# Altium schematic sheet POWER-1.SchDoc
size A4
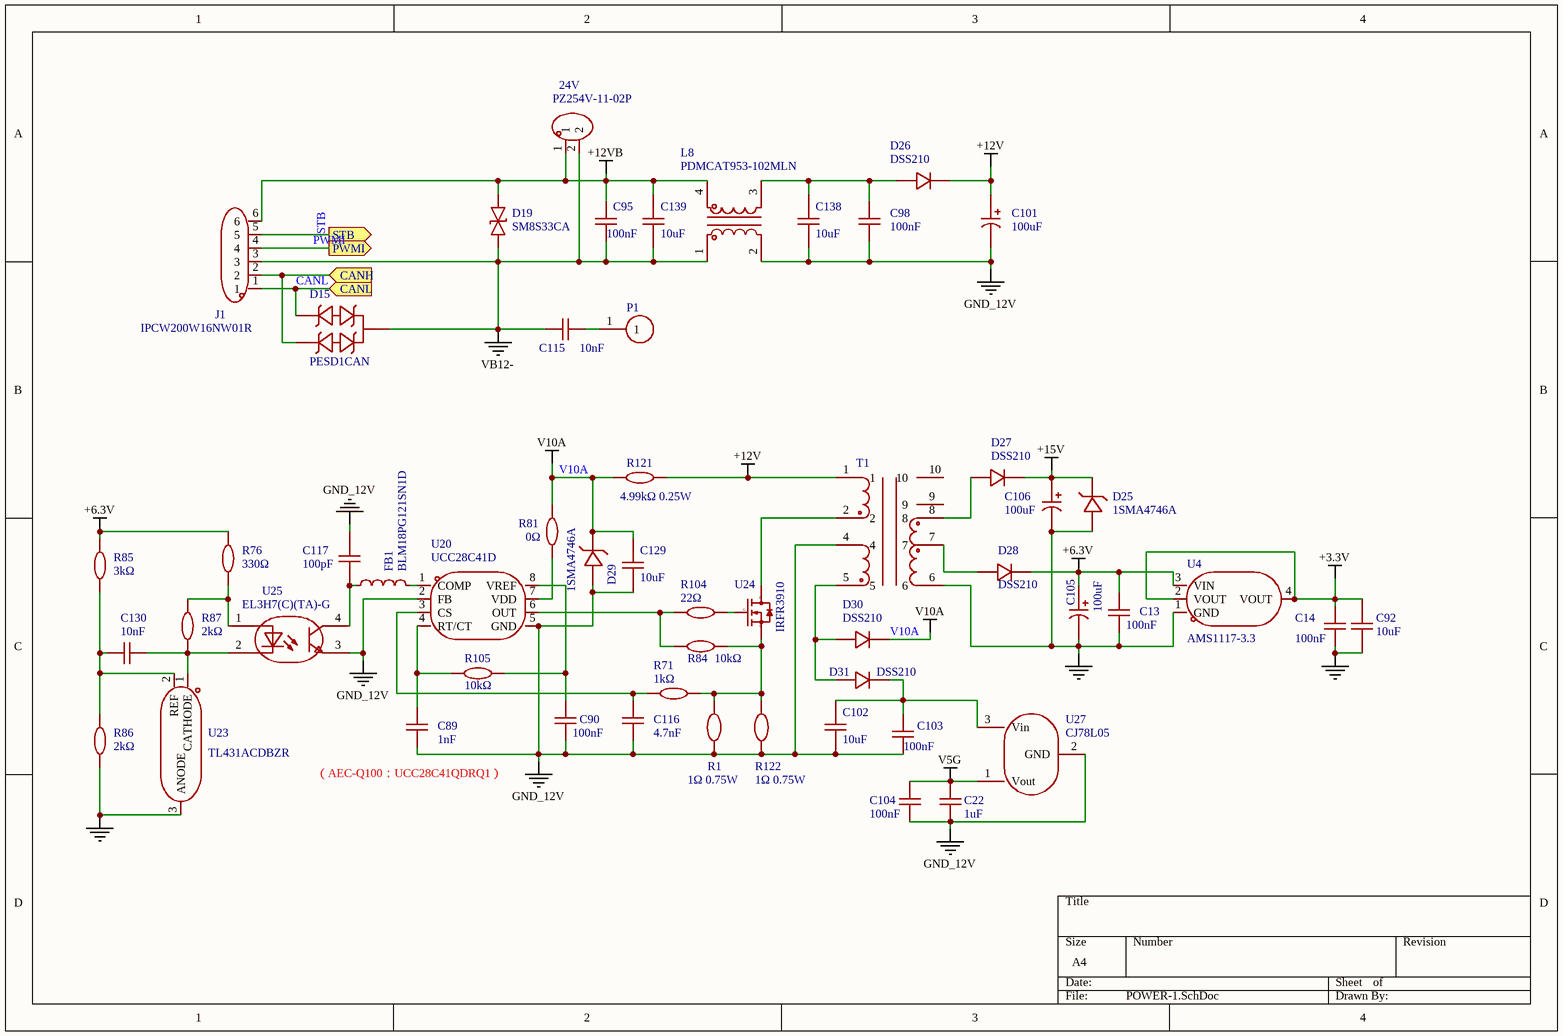
[diagram p0: POWER-1.SchDoc]

## Parts
24V  PZ254V-11-02P  [jp2]
C13  100nF  [C0603]
C14  100nF  [C0603]
C22  1uF  [C0603]
C89  1nF  [C0603]
C90  100nF  [C0603]
C92  10uF  [C1206]
C95  100nF  [C0603]
C98  100nF  [C0603]
C101  100uF  [CAP-SMD_BD6.3-L6.6-W6.6-LS7.6-FD-1]
C102  10uF  [C1206]
C103  100nF  [C0603]
C104  100nF  [C0603]
C105  100uF  [CAP-SMD_BD6.3-L6.6-W6.6-LS7.6-FD-1]
C106  100uF  [CAP-SMD_BD6.3-L6.6-W6.6-LS7.6-FD-1]
C115  10nF  [C1206]
C116  4.7nF  [C0603]
C117  100pF  [C0603]
C129  10uF  [C1206]
C130  10nF  [C0603]
C138  10uF  [C1206]
C139  10uF  [C1206]
D15  PESD1CAN  [SOT-23-3_L2.9-W1.6-P1.90-LS2.8-BR]
D19  SM8S33CA  [DO-218AB_L13.5-W8.4-LS15.5-BI]
D25  1SMA4746A  [SMA_L4.4-W2.6-LS5.0-RD]
D26  DSS210  [SOD-123_L2.8-W1.8-LS3.7-FD]
D27  DSS210  [SOD-123_L2.8-W1.8-LS3.7-FD]
D28  DSS210  [SOD-123_L2.8-W1.8-LS3.7-FD]
D29  1SMA4746A  [SMA_L4.4-W2.6-LS5.0-RD]
D30  DSS210  [SOD-123_L2.8-W1.8-LS3.7-FD]
D31  DSS210  [SOD-123_L2.8-W1.8-LS3.7-FD]
FB1  BLM18PG121SN1D  [L0603]
J1  IPCW200W16NW01R  [CONN-TH_6P-P2.00_INCP_IPCW200W16XWXXR]
L8  PDMCAT953-102MLN  [IND-TH_4P-L12.0-W6.0_PDMCAT953-501MLN]
P1  (no value)  [HOLE-3.5]
R1  1Ω 0.75W  [R1206]
R71  1kΩ  [R0603]
R76  330Ω  [R0603]
R81  0Ω  [R0603]
R84  10kΩ  [R0603]
R85  3kΩ  [R0603]
R86  2kΩ  [R0603]
R87  2kΩ  [R0603]
R104  22Ω  [R0603]
R105  10kΩ  [R0603]
R121  4.99kΩ 0.25W  [R0805]
R122  1Ω 0.75W  [R1206]
T1  (no value)  [汽车空调压缩机板-变压器]
U4  AMS1117-3.3  [SOT-223-3_L6.5-W3.4-P2.30-LS7.0-BR]
U20  UCC28C41D  [SOIC-8_L4.9-W3.9-P1.27-LS6.0-BL]
U23  TL431ACDBZR  [SOT-23-3_L3.0-W1.7-P0.95-LS2.9-BR]
U24  IRFR3910  [TO-252-2_L6.6-W6.1-P4.57-LS9.9-BR-CW]
U25  EL3H7(C)(TA)-G  [SMD-4_L2.7-W4.4-P1.27-LS7.0-BL]
U27  CJ78L05  [SOT-89-3_L4.5-W2.5-P1.50-LS4.2-BR]

## Ports
CANH (in), CANL (in), PWMI (out), STB (out)

## Nets
+3.3V: C14.1 C92.2 U4.2(VOUT) U4.4(VOUT)
+6.3V: C13.1 C105.1 D28.2(K) R76.2 R85.2 U4.3(VIN)
+12V: C101.1 D26.2(K) R121.2 T1.1
+12VB: 24V.1 C95.1 C139.2 D19.2 J1.6 L8.4
+15V: C106.1 D25.1(K) D27.2(K)
GND: C13.2 C14.2 C92.1 C105.2 C106.2 D25.2(A) R86.1 T1.6 U4.1(GND) U23.3(ANODE)
GND_12V: C22.1 C89.1 C90.2 C98.2 C101.2 C102.1 C103.2 C104.2 C116.1 C117.2 C129.1 C138.1 D29.2(A) L8.2 R1.1 R122.1 T1.4 U20.2(FB) U20.5(GND) U25.3 U27.2(GND)
V5G: C22.2 C104.1 U27.1(Vout)
V10A: C129.2 D29.1(K) D30.2(K) R81.2 R121.1
VB12-: 24V.2 C95.2 C115.1 C139.1 D15.3 D19.1 J1.3 L8.1
CANH: D15.1 J1.2 ; port CANH
CANL: D15.2 J1.1 ; port CANL
PWMI: J1.4 ; port PWMI
STB: J1.5 ; port STB
NetC89_2: C89.2 R105.1 U20.4(RT/CT)
NetC90_1: C90.1 R105.2 U20.8(VREF)
NetC98_1: C98.1 C138.2 D26.1(A) L8.3
NetC102_2: C102.2 C103.1 D31.2(K) U27.3(Vin)
NetC115_2: C115.2 P1.1
NetC116_2: C116.2 R71.1 U20.3(CS)
NetC117_1: C117.1 FB1.1 U25.4
NetC130_1: C130.1 R85.1 R86.2 U23.2(REF)
NetC130_2: C130.2 R87.2 U23.1(CATHODE) U25.2
NetD27_1: D27.1(A) T1.8
NetD28_1: D28.1(A) T1.7
NetD30_1: D30.1(A) D31.1(A) T1.5
NetFB1_2: FB1.2 U20.1(COMP)
NetR1_2: R1.2 R71.2 R84.2 R122.2 U24.3(S)
NetR76_1: R76.1 R87.1 U25.1
NetR81_1: R81.1 U20.7(VDD)
NetR84_1: R84.1 R104.1 U20.6(OUT)
NetR104_2: R104.2 U24.1(G)
NetT1_2: T1.2 U24.2(D)

Not connected (* = marked no-connect by the designer): T1 9 10

## Notes on the sheet
- (near C89) （AEC-Q100：UCC28C41QDRQ1）

## Library data of the parts
24V = PZ254V-11-02P: 插针结构:1x2P;间距:2.54mm;行距:-;圆针/方针:方针;安装类型:直插;排数:单排;总PIN位数:2P;额定电流:-;额定电压:-;配合针长度:6mm;塑高:2.5mm;端接针长度:3mm;触头材质:黄铜;触头镀层:-;工作温度范围:-40℃~+105℃;颜色:黑色;; Manufacturer: XFCN(兴飞); Add into BOM: yes; Pin Structure: 1x2P; Pitch: 2.54mm; Circluar Pins/Square Pins: 方针; Symbol: PZ254V-11-02P; Device: PZ254V-11-02P; Supplier: LCSC; Supplier Part: C492401; Manufacturer Part: PZ254V-11-02P; JLCPCB Part Class: Extended Part; LCSC Part Name: 间距:2.54mm 1x2P 直插 方针; Supplier Footprint: 插件,P=2.54mm; Datasheet: https://atta.szlcsc.com/upload/public/pdf/source/20200309/C492401_A812433581A9B211A7FFA413ADDFF0E5.pdf; Convert to PCB: yes; Row Spacing: -; Mounting Type: 直插; Number of Rows: 单排; Number of Pins: 2P; Current Rating (Max): -; Voltage Rating (Max): -; Length of Mating Pin: 6mm; Insulation Height: 2.5mm; Length of End Connection Pin: 3mm; Contact Material: 黄铜; Contact Plating: -; Operating Temperature Range: -40℃~+105℃; Color: 黑色; Comment_1: PZ254V-11-02P
C13 C14 C90 C95 C98 C103 C104 = 0603B104K500NT: 容值:100nF;精度:±10%;额定电压:50V;材质(温度系数):X7R;; Manufacturer: FH(风华); Add into BOM: yes; Tolerance: ±10%; Voltage Rated: 50V; Temperature Coefficient: X7R; Symbol: 0603B104K500NT; Device: 0603B104K500NT; Supplier: LCSC; Manufacturer Part: 0603B104K500NT; Value: 100nF; Supplier Part: C30926; JLCPCB Part Class: 扩展库; LCSC Part Name: 100nF ±10% 50V; Supplier Footprint: 0603; Datasheet: https://atta.szlcsc.com/upload/public/pdf/source/20200305/C486355_26A10D38EF8C2A5C37091D0039909270.pdf; Convert to PCB: yes; Comment_1: 100nF
C22 = 0603B105K250NT: 容值:1uF;精度:±10%;额定电压:25V;材质(温度系数):X7R;; Manufacturer: FH(风华); Add into BOM: yes; Tolerance: ±10%; Voltage Rated: 25V; Temperature Coefficient: X7R; Symbol: 0603B105K250NT; Device: 0603B105K250NT; LCSC Part Name: 1uF ±10% 25V; Supplier Part: C59302; Manufacturer Part: 0603B105K250NT; Supplier Footprint: 0603; JLCPCB Part Class: 扩展库; Datasheet: https://atta.szlcsc.com/upload/public/pdf/source/20200305/C486355_26A10D38EF8C2A5C37091D0039909270.pdf; Supplier: LCSC; Convert to PCB: yes; Value: 1uF; Comment_1: 1uF
C89 = CC0603KRX7R9BB102: 容值:1nF;精度:±10%;额定电压:50V;材质(温度系数):X7R;; Manufacturer: YAGEO(国巨); Add into BOM: yes; Tolerance: ±10%; Voltage Rated: 50V; Temperature Coefficient: X7R; Symbol: CC0603KRX7R9BB102; Device: CC0603KRX7R9BB102; Supplier: LCSC; Manufacturer Part: CC0603KRX7R9BB102; Value: 1nF; Supplier Part: C100040; JLCPCB Part Class: 扩展库; LCSC Part Name: 1nF ±10% 50V; Supplier Footprint: 0603; Datasheet: https://atta.szlcsc.com/upload/public/pdf/source/20180910/C282072_33301C7F631E79921B82A8DAC6BCC5B3.pdf; Convert to PCB: yes; Comment_1: 1nF
C92 C102 C129 C138 C139 = 1206B106K250NT: 容值:10uF;精度:±10%;额定电压:25V;材质(温度系数):X7R;; Manufacturer: FH(风华); Add into BOM: yes; Tolerance: ±10%; Voltage Rated: 25V; Temperature Coefficient: X7R; Symbol: 1206B106K250NT; Device: 1206B106K250NT; Supplier: LCSC; Manufacturer Part: 1206B106K250NT; Value: 10uF; Supplier Part: C90538; JLCPCB Part Class: 扩展库; LCSC Part Name: 10uF ±10% 25V; Supplier Footprint: 1206; Datasheet: https://atta.szlcsc.com/upload/public/pdf/source/20200305/C486355_26A10D38EF8C2A5C37091D0039909270.pdf; Convert to PCB: yes; Comment_1: 10uF
C101 C105 C106 = RVE100UF35V67RV0072: 容值:100uF;精度:±20%;额定电压:35V;纹波电流:230mA@120Hz;等效串联电阻:600mΩ@100kHz;; Manufacturer: KNSCHA(科尼盛); Add into BOM: yes; Tolerance: ±20%; Rated Voltage: 35V; φD: 6.3mm; L: 7.7mm; Lifetime @ Temp: 2000hrs@105℃; Symbol: RVE100UF35V67RV0072; Device: RVE100UF35V67RV0072; Supplier: LCSC; Supplier Part: C2836437; Manufacturer Part: RVE100UF35V67RV0072; Value: 100uF; JLCPCB Part Class: 扩展库; LCSC Part Name: 100uF ±20% 35V; Supplier Footprint: SMD,D6.3xL7.7mm; Datasheet: https://atta.szlcsc.com/upload/public/pdf/source/20220719/B52EB46F8A1558448ED03D8B4CB3C24F.pdf; Convert to PCB: yes; Ripple Current: 230mA@120Hz; Equivalent Series Resistance(ESR): 600mΩ@100kHz; Operating Temperature: -55℃~+105℃; Comment_1: 100uF
C115 = 1206B103K202NT: 容值:10nF;精度:±10%;额定电压:2kV;材质(温度系数):X7R;; Manufacturer: FH(风华); Add into BOM: yes; Tolerance: ±10%; Voltage Rated: 2kV; Temperature Coefficient: X7R; Symbol: 1206B103K202NT; Device: 1206B103K202NT; Supplier: LCSC; Manufacturer Part: 1206B103K202NT; Value: 10nF; Supplier Part: C53737; JLCPCB Part Class: 扩展库; LCSC Part Name: 10nF ±10% 2kV; Supplier Footprint: 1206; Datasheet: https://atta.szlcsc.com/upload/public/pdf/source/20200305/C486355_26A10D38EF8C2A5C37091D0039909270.pdf; Convert to PCB: yes; Comment_1: 10nF
C116 = 0603B472K500NT: 容值:4.7nF;精度:±10%;额定电压:50V;材质(温度系数):X7R;; Manufacturer: FH(风华); Add into BOM: yes; Tolerance: ±10%; Voltage Rated: 50V; Temperature Coefficient: X7R; Symbol: 0603B472K500NT; Device: 0603B472K500NT; LCSC Part Name: 4.7nF ±10% 50V; Supplier Part: C53987; Manufacturer Part: 0603B472K500NT; Supplier Footprint: 0603; JLCPCB Part Class: 基础库; Datasheet: https://atta.szlcsc.com/upload/public/pdf/source/20200305/C486355_26A10D38EF8C2A5C37091D0039909270.pdf; Supplier: LCSC; Convert to PCB: yes; Value: 4.7nF; Comment_1: 4.7nF
C117 = CC0603JRNPO9BN101: 容值:100pF;精度:±5%;额定电压:50V;材质(温度系数):NP0;; Manufacturer: YAGEO(国巨); Add into BOM: yes; Tolerance: ±5%; Voltage Rated: 50V; Temperature Coefficient: NP0; Symbol: CC0603JRNPO9BN101; Device: CC0603JRNPO9BN101; Supplier: LCSC; Manufacturer Part: CC0603JRNPO9BN101; Value: 100pF; Supplier Part: C14665; JLCPCB Part Class: 扩展库; LCSC Part Name: 100pF ±5% 50V; Supplier Footprint: 0603; Datasheet: https://atta.szlcsc.com/upload/public/pdf/source/20181008/C309499_21CC21451B82C39E3D92150FD6B30293.pdf; Convert to PCB: yes; Comment_1: 100pF
C130 = CC0603KRX7R9BB103: 容值:10nF;精度:±10%;额定电压:50V;材质(温度系数):X7R;; Manufacturer: YAGEO(国巨); Add into BOM: yes; Tolerance: ±10%; Voltage Rated: 50V; Temperature Coefficient: X7R; Symbol: CC0603KRX7R9BB103; Device: CC0603KRX7R9BB103; Supplier: LCSC; Manufacturer Part: CC0603KRX7R9BB103; Value: 10nF; Supplier Part: C100042; JLCPCB Part Class: 扩展库; LCSC Part Name: 10nF ±10% 50V; Supplier Footprint: 0603; Datasheet: https://atta.szlcsc.com/upload/public/pdf/source/20181008/C309510_22F155564471FAF6A489F7D68F34234E.pdf; Convert to PCB: yes; Comment_1: 10nF
D15 = PESD1CAN_C907838: Manufacturer: TECH PUBLIC(台舟); Add into BOM: yes; Symbol: PESD1CAN_C907838; Device: PESD1CAN_C907838; Supplier: LCSC; Supplier Part: C907838; Manufacturer Part: PESD1CAN; JLCPCB Part Class: 扩展库; LCSC Part Name: PESD1CAN 丝印tAN 双向24V; Supplier Footprint: SOT-23; Datasheet: https://atta.szlcsc.com/upload/public/pdf/source/20210810/FCC54A7A88EA9EF2EA40F9636152B7D7.pdf; Convert to PCB: yes; Comment_1: PESD1CAN
D19 = SM8S33CA_C314434: 反向截止电压(Vrwm):33V;最大钳位电压:53.3V;峰值脉冲电流(Ipp)@10/1000us:124A;击穿电压:36.7V;; Manufacturer: DOWO(东沃); Add into BOM: yes; Reverse Stand-Off Voltage (Vrwm): 33V; Maximum Clamping Voltage: 53.3V; Peak Pulse Current (Ipp)@10/1000us: 124A; Breakdown Voltage: 36.7V; Reverse Leakage Current (Ir): 10uA; Type: TVS; Symbol: SM8S33CA; Device: SM8S33CA_C314434; LCSC Part Name: TVS 33V截止 124A峰值脉冲; Supplier Part: C314434; Manufacturer Part: SM8S33CA; Supplier Footprint: DO-218AB; JLCPCB Part Class: 扩展库; Datasheet: https://atta.szlcsc.com/upload/public/pdf/source/20181106/C314437_31B54DA73456FA681A2859957BB4B0B1.pdf; Supplier: LCSC; Convert to PCB: yes; Comment_1: SM8S33CA
D25 D29 = 1SMA4746A_C173483: 二极管配置:独立式;稳压值(标称值):18V;稳压值(范围):17.1V~18.9V;功率:1W;精度:-;; Manufacturer: MDD; Add into BOM: yes; Diode Configuration: 独立式; Zener Voltage (Nom): 18V; Reverse Leakage Current (Ir): 5uA@13.7V; Power Dissipation: 1W; Zener Impedance (Zzt): 20Ω; Symbol: 1SMA4746A_C173483; Device: 1SMA4746A_C173483; Supplier: LCSC; Supplier Part: C173483; Manufacturer Part: 1SMA4746A; JLCPCB Part Class: 扩展库; LCSC Part Name: 1SMA4746A; Supplier Footprint: SMA(DO-214AC); Datasheet: https://atta.szlcsc.com/upload/public/pdf/source/20230314/D3FB3E27E1B37F88B63DBD3F994A8ACA.pdf; Convert to PCB: yes; Zener Voltage (Range): 17.1V~18.9V; Tolerance: -; Comment_1: 1SMA4746A
D26-D28 D30 D31 = DSS210_C511868: 正向压降(Vf):850mV@2A;直流反向耐压(Vr):100V;平均整流电流(Io):2A;; Manufacturer: BORN(伯恩半导体); Add into BOM: yes; Reverse Voltage (Vr): 100V; Average Rectified Current (Io): 2A; Symbol: DSS210; Device: DSS210_C511868; Supplier: LCSC; Supplier Part: C511868; Manufacturer Part: DSS210; JLCPCB Part Class: 扩展库; LCSC Part Name: 电压:100V 电流:2A; Supplier Footprint: SOD-123FL; Datasheet: https://atta.szlcsc.com/upload/public/pdf/source/20230516/9F85296B942B21E2E4298CE8290C4B88.pdf; Convert to PCB: yes; Forward Voltage (Vf@If): 850mV@2A; Comment_1: DSS210
FB1 = BLM18PG121SN1D: 标称阻抗@测试频率:120Ω@100MHz;误差:±25%;直流电阻(RDC):50mΩ;; Manufacturer: muRata(村田); Symbol: BLM18PG121SN1D_C14709; Add into BOM: yes; Tolerance: ±25%; DC Resistance: 50mΩ; Current Rating: 2A; Circuits: 1; Device: BLM18PG121SN1D; LCSC Part Name: 单路 0603磁珠 阻抗120Ω@100MHz; Supplier Part: C14709; Manufacturer Part: BLM18PG121SN1D; Supplier Footprint: 0603; JLCPCB Part Class: 扩展库; Datasheet: https://atta.szlcsc.com/upload/public/pdf/source/20130704/1457706621422.pdf; Supplier: LCSC; Convert to PCB: yes; Impedance @ Frequency: 120Ω@100MHz; Comment_1: BLM18PG121SN1D
J1 = IPCW200W16NW01R: 插针结构:1x6P;间距:2mm;安装方式:弯插;参考系列:PH;总PIN数:6P;排数:1;每排PIN数:6;工作温度范围:-25℃~+85℃;; Manufacturer: INCP; Add into BOM: yes; Pins Structure: 1x6P; Pitch: 2mm; Reference Series: PH; Number of PINs Per Row: 6; Symbol: IPCW200W16NW01R; Device: IPCW200W16NW01R; Supplier: LCSC; Supplier Part: C2982159; Manufacturer Part: IPCW200W16NW01R; JLCPCB Part Class: 扩展库; LCSC Part Name: IPCW200W16NW01R; Supplier Footprint: 弯插,P=2mm; Datasheet: https://atta.szlcsc.com/upload/public/pdf/source/20220328/BD62D14CAC78066D83B81F1997E899D7.pdf; Convert to PCB: yes; Mounting Style: 弯插; Number of Pins: 6P; Number of Rows: 1; Operating Temperature Range: -25℃~+85℃; Comment_1: IPCW200W16NW01R
L8 = PDMCAT953-102MLN: 线路数:2;电感 @ 频率:1mH@1kHz;直流电阻(DCR):25mΩ;; Manufacturer: PROD(谱罗德); Add into BOM: yes; Number of Lines: 2; Current Rating: 1.5A; DC Resistance (DCR): 25mΩ; Symbol: PDMCAT953-102MLN; Device: PDMCAT953-102MLN; Supplier: LCSC; Supplier Part: C5158067; Manufacturer Part: PDMCAT953-102MLN; JLCPCB Part Class: 扩展库; LCSC Part Name: 共模电感1mH 1.5A 25mΩMAX 953环 过EMC; Supplier Footprint: 插件; Datasheet: https://atta.szlcsc.com/upload/public/pdf/source/20220920/90718629BFB021D2715AF2FDDA682A79.pdf; Convert to PCB: yes; Inductance @ Frequency: 1mH@1kHz; Comment_1: PDMCAT953-102MLN
P1 = PAD-ED: Add into BOM: yes; Symbol: PAD-ED; Device: PAD-ED; Convert to PCB: yes; Comment_1: PAD-ED
R1 R122 = CRCW12061R00FKEAHP: 电阻类型:厚膜电阻;阻值:1Ω;精度:±1%;功率:750mW;温度系数:±100ppm/℃;; Manufacturer: VISHAY(威世); Add into BOM: yes; Tolerance: ±1%; Power(Watts): 750mW; Symbol: CRCW12061R00FKEAHP; Device: CRCW12061R00FKEAHP; LCSC Part Name: 厚膜电阻 1Ω ±1% 750mW; Supplier Part: C844653; Manufacturer Part: CRCW12061R00FKEAHP; Supplier Footprint: 1206; JLCPCB Part Class: 扩展库; Datasheet: https://atta.szlcsc.com/upload/public/pdf/source/20221018/EBA0766182E7785923AA75C06FB4488F.pdf; Supplier: LCSC; Convert to PCB: yes; Type: 厚膜电阻; Value: 1Ω 0.75W; Temperature Coefficient: ±100ppm/℃; Operating Temperature Range: -55℃~+155℃; Comment_1: 1Ω 0.75W
R71 = 0603WAF1001T5E: 电阻类型:厚膜电阻;阻值:1kΩ;精度:±1%;功率:100mW;最大工作电压:75V;温度系数:±100ppm/℃;; Manufacturer: UNI-ROYAL(厚声); Add into BOM: yes; Tolerance: ±1%; Power(Watts): 100mW; Overload Voltage (Max): 75V; Symbol: 0603WAF1001T5E; Device: 0603WAF1001T5E; Supplier: LCSC; Manufacturer Part: 0603WAF1001T5E; Supplier Part: C21190; Value: 1kΩ; JLCPCB Part Class: 基础库; LCSC Part Name: 1kΩ ±1% 100mW 厚膜电阻; Supplier Footprint: 0603; Datasheet: https://atta.szlcsc.com/upload/public/pdf/source/20200306/C422600_1E6D84923E4A46A82E41ADD87F860B5C.pdf; Convert to PCB: yes; Type: 厚膜电阻; Temperature Coefficient: ±100ppm/℃; Operating Temperature Range: -55℃~+155℃; Comment_1: 1kΩ
R76 = 0603WAF3300T5E: 电阻类型:厚膜电阻;阻值:330Ω;精度:±1%;功率:100mW;最大工作电压:75V;温度系数:±100ppm/℃;; Manufacturer: UNI-ROYAL(厚声); Add into BOM: yes; Tolerance: ±1%; Power(Watts): 100mW; Overload Voltage (Max): 75V; Symbol: 0603WAF3300T5E; Device: 0603WAF3300T5E; Supplier: LCSC; Manufacturer Part: 0603WAF3300T5E; Supplier Part: C23138; Value: 330Ω; JLCPCB Part Class: 基础库; LCSC Part Name: 330Ω ±1% 100mW 厚膜电阻; Supplier Footprint: 0603; Datasheet: https://atta.szlcsc.com/upload/public/pdf/source/20200306/C422600_1E6D84923E4A46A82E41ADD87F860B5C.pdf; Convert to PCB: yes; Type: 厚膜电阻; Temperature Coefficient: ±100ppm/℃; Operating Temperature Range: -55℃~+155℃; Comment_1: 330Ω
R81 = 0603WAF0000T5E: 电阻类型:厚膜电阻;阻值:0Ω;精度:±1%;功率:100mW;最大工作电压:75V;; Manufacturer: UNI-ROYAL(厚声); Add into BOM: yes; Tolerance: ±1%; Power(Watts): 100mW; Overload Voltage (Max): 75V; Symbol: 0603WAF0000T5E; Device: 0603WAF0000T5E; Supplier: LCSC; Manufacturer Part: 0603WAF0000T5E; Supplier Part: C21189; Value: 0Ω; JLCPCB Part Class: 基础库; LCSC Part Name: 0Ω ±1% 100mW 厚膜电阻; Supplier Footprint: 0603; Datasheet: https://atta.szlcsc.com/upload/public/pdf/source/20200306/C422600_1E6D84923E4A46A82E41ADD87F860B5C.pdf; Convert to PCB: yes; Type: 厚膜电阻; Operating Temperature Range: -55℃~+155℃; Comment_1: 0Ω
R84 R105 = 0603WAF1002T5E: 电阻类型:厚膜电阻;阻值:10kΩ;精度:±1%;功率:100mW;最大工作电压:75V;温度系数:±100ppm/℃;; Manufacturer: UNI-ROYAL(厚声); Add into BOM: yes; Tolerance: ±1%; Power(Watts): 100mW; Overload Voltage (Max): 75V; Symbol: 0603WAF1002T5E; Device: 0603WAF1002T5E; Supplier: LCSC; Manufacturer Part: 0603WAF1002T5E; Supplier Part: C25804; Value: 10kΩ; JLCPCB Part Class: 基础库; LCSC Part Name: 厚膜电阻 10kΩ ±1% 100mW; Supplier Footprint: 0603; Datasheet: https://atta.szlcsc.com/upload/public/pdf/source/20200306/C422600_1E6D84923E4A46A82E41ADD87F860B5C.pdf; Convert to PCB: yes; Type: 厚膜电阻; Temperature Coefficient: ±100ppm/℃; Operating Temperature Range: -55℃~+155℃; Comment_1: 10kΩ
R85 = 0603WAF3001T5E: 电阻类型:厚膜电阻;阻值:3kΩ;精度:±1%;功率:100mW;最大工作电压:75V;温度系数:±100ppm/℃;; Manufacturer: UNI-ROYAL(厚声); Add into BOM: yes; Tolerance: ±1%; Power(Watts): 100mW; Overload Voltage (Max): 75V; Symbol: 0603WAF3001T5E; Device: 0603WAF3001T5E; Supplier: LCSC; Manufacturer Part: 0603WAF3001T5E; Supplier Part: C4211; Value: 3kΩ; JLCPCB Part Class: 基础库; LCSC Part Name: 3kΩ ±1% 100mW 厚膜电阻; Supplier Footprint: 0603; Datasheet: https://atta.szlcsc.com/upload/public/pdf/source/20200306/C422600_1E6D84923E4A46A82E41ADD87F860B5C.pdf; Convert to PCB: yes; Type: 厚膜电阻; Temperature Coefficient: ±100ppm/℃; Operating Temperature Range: -55℃~+155℃; Comment_1: 3kΩ
R86 R87 = 0603WAF2001T5E: 电阻类型:厚膜电阻;阻值:2kΩ;精度:±1%;功率:100mW;最大工作电压:75V;温度系数:±100ppm/℃;; Manufacturer: UNI-ROYAL(厚声); Add into BOM: yes; Tolerance: ±1%; Power(Watts): 100mW; Overload Voltage (Max): 75V; Symbol: 0603WAF2001T5E; Device: 0603WAF2001T5E; Supplier: LCSC; Manufacturer Part: 0603WAF2001T5E; Supplier Part: C22975; Value: 2kΩ; JLCPCB Part Class: 基础库; LCSC Part Name: 2kΩ ±1% 100mW 厚膜电阻; Supplier Footprint: 0603; Datasheet: https://atta.szlcsc.com/upload/public/pdf/source/20200306/C422600_1E6D84923E4A46A82E41ADD87F860B5C.pdf; Convert to PCB: yes; Type: 厚膜电阻; Temperature Coefficient: ±100ppm/℃; Operating Temperature Range: -55℃~+155℃; Comment_1: 2kΩ
R104 = 0603WAF220JT5E: 电阻类型:厚膜电阻;阻值:22Ω;精度:±1%;功率:100mW;最大工作电压:75V;温度系数:±100ppm/℃;; Manufacturer: UNI-ROYAL(厚声); Add into BOM: yes; Tolerance: ±1%; Power(Watts): 100mW; Overload Voltage (Max): 75V; Symbol: 0603WAF220JT5E; Device: 0603WAF220JT5E; Supplier: LCSC; Manufacturer Part: 0603WAF220JT5E; Supplier Part: C23345; Value: 22Ω; JLCPCB Part Class: 基础库; LCSC Part Name: 22Ω ±1% 100mW 厚膜电阻; Supplier Footprint: 0603; Datasheet: https://atta.szlcsc.com/upload/public/pdf/source/20200306/C422600_1E6D84923E4A46A82E41ADD87F860B5C.pdf; Convert to PCB: yes; Type: 厚膜电阻; Temperature Coefficient: ±100ppm/℃; Operating Temperature Range: -55℃~+155℃; Comment_1: 22Ω
R121 = TC0525D4991T5E: 电阻类型:薄膜电阻;阻值:4.99kΩ;精度:±0.5%;功率:250mW;最大工作电压:150V;温度系数:±25ppm/℃;; Manufacturer: UNI-ROYAL(厚声); Add into BOM: yes; Tolerance: ±0.5%; Power(Watts): 250mW; Overload Voltage (Max): 150V; Symbol: TC0525D4991T5E; Device: TC0525D4991T5E; Supplier: LCSC; Supplier Part: C111401; Manufacturer Part: TC0525D4991T5E; Value: 4.99kΩ 0.25W; JLCPCB Part Class: 扩展库; LCSC Part Name: 4.99kΩ ±0.5% 250mW 薄膜电阻; Supplier Footprint: 0805; Datasheet: https://atta.szlcsc.com/upload/public/pdf/source/20190904/C425668_F2F639A313B6F33D501F342892FD5229.pdf; Convert to PCB: yes; Type: 薄膜电阻; Temperature Coefficient: ±25ppm/℃; Operating Temperature Range: -55℃~+155℃; Comment_1: 4.99kΩ 0.25W
T1 = 高频变压器-8pin: Add into BOM: yes; Symbol: 高频变压器-8pin; Device: 高频变压器-8pin; Convert to PCB: yes; Comment_1: 高频变压器-8pin
U4 = AMS1117-3.3_C6186: 输出类型:固定;最大输入电压:-;输出电压:3.3V;最大输出电流:1A;电源纹波抑制比(PSRR):72dB@(120Hz);输出极性:正极;; Manufacturer: AMS; Add into BOM: yes; Output Type: 固定; Output Voltage: 3.3V; MAX Output Current: 1A; Dropout Voltage: 1.3V@(800mA); Output Polarity: 正极; Number of Outputs: 1; Symbol: AMS1117-3.3; Device: AMS1117-3.3_C6186; Supplier: LCSC; Manufacturer Part: AMS1117-3.3; Supplier Part: C6186; JLCPCB Part Class: 基础库; LCSC Part Name: 输出3.3V 1A; Supplier Footprint: SOT-223-3; Datasheet: https://atta.szlcsc.com/upload/public/pdf/source/20180727/C6186_7A095716F0823C02F1997A905E26C086.pdf; Convert to PCB: yes; Maximum Input Voltage: -; Power Supply Rejection Ratio (PSRR): 72dB@(120Hz); standby current: -; Noise: -; Feature: -; Operating Temperature: -; Comment_1: AMS1117-3.3
U20 = UCC28C41D: 电源电压:6.6V~18V;开关频率:1MHz;; Manufacturer: TI(德州仪器); Add into BOM: yes; Switching Frequency: 1MHz; Topology: 反激式；正激式；升压式; Symbol: UCC28C41D; Device: UCC28C41D; Supplier: LCSC; Supplier Part: C1530208; Manufacturer Part: UCC28C41D; JLCPCB Part Class: 扩展库; LCSC Part Name: UCC28C41D; Supplier Footprint: SOIC-8; Datasheet: https://www.ti.com/cn/lit/gpn/ucc38c44; Convert to PCB: yes; Supply Voltage: 6.6V~18V; Comment_1: UCC28C41D
U23 = TL431ACDBZR: 输出类型:可调;输入电压:-;输出电压:2.495V~36V;输出电流:100mA;精度:±1%;; Manufacturer: TI(德州仪器); Add into BOM: yes; Output Type: 可调; Output Current: 100mA; Tolerance: ±1%; Reference Type: 并联; Minimum Cathode Current for Regulation: 600uA; Symbol: TL431ACDBZR; Device: TL431ACDBZR; Supplier: LCSC; Supplier Part: C350683; Manufacturer Part: TL431ACDBZR; JLCPCB Part Class: 扩展库; LCSC Part Name: TL431ACDBZR; Supplier Footprint: SOT-23; Datasheet: https://www.ti.com/cn/lit/gpn/tl431; Convert to PCB: yes; Input Voltage: -; Output Voltage: 2.495V~36V; Temperature Coefficient: -; Supply Current: -; Noise - 1/10Hz to 10Hz: -; Noise - 10Hz to 10kHz: -; Operating Temperature: 0℃~+70℃@(Ta); Comment_1: TL431ACDBZR
U24 = IRFR3910_C5350891: Manufacturer: TECH PUBLIC(台舟); Add into BOM: yes; Symbol: IRFR3910_C5350891; Device: IRFR3910_C5350891; LCSC Part Name: IRFR3910; Supplier Part: C5350891; Manufacturer Part: IRFR3910; Supplier Footprint: TO-252AA; Datasheet: https://atta.szlcsc.com/upload/public/pdf/source/20230110/4659E50EA0163D3F6252434384E1C4FF.pdf; Supplier: LCSC; Convert to PCB: yes; Comment_1: IRFR3910
U25 = EL3H7(C)(TA)-G: 输入电压类型:DC;正向电压:1.2V;输出电流:50mA;隔离电压(rms):3.75kV;反向电压:6V;接收端电压:80V;输出通道数:1;集射极饱和电压(Vce(sat)@Ic,IF):100mV@1mA,10mA;; Manufacturer: EVERLIGHT(亿光); Add into BOM: yes; Input voltage type: DC; Output Type: 光电三极管; Forward Voltage: 1.2V; Output Current: 50mA; Isolation Voltage(rms): 3.75kV; Reverse Voltage: 6V; Receiving End Voltage: 80V; Number of Outputs: 1; Rise time: 5us@2mA,100Ω; Fall time: 3us@2mA,100Ω; Symbol: EL3H7(C)(TA)-G; Device: EL3H7(C)(TA)-G; Supplier: LCSC; Manufacturer Part: EL3H7(C)(TA)-G; Supplier Part: C92243; JLCPCB Part Class: 扩展库; LCSC Part Name: DC输入 隔离电压(rms):3750V; Supplier Footprint: SOIC-4-175mil; Datasheet: https://atta.szlcsc.com/upload/public/pdf/source/20180207/C181879_15179899084781356541.pdf; Convert to PCB: yes; Collector-Emitter Saturation Voltage (Vce(sat)@Ic,IF): 100mV@1mA,10mA; Operating Temperature: -55℃~+110℃; Comment_1: EL3H7(C)(TA)-G
U27 = CJ78L05_C2079: 输出类型:固定;最大输入电压:30V;输出电压:5V;最大输出电流:100mA;输出极性:正极;; Manufacturer: CJ(江苏长电/长晶); Add into BOM: yes; Output Type: 固定; Maximum Input Voltage: 30V; Output Voltage: 5V; MAX Output Current: 100mA; Dropout Voltage: 1.7V@(40mA); Output Polarity: 正极; Number of Outputs: 1; Symbol: CJ78L05; Device: CJ78L05_C2079; LCSC Part Name: 输入30V 输出5V 100mA; Supplier Part: C2079; Manufacturer Part: CJ78L05; Supplier Footprint: SOT-89-3L; JLCPCB Part Class: 扩展库; Datasheet: https://atta.szlcsc.com/upload/public/pdf/source/20171228/C164903_15144413069831213906.pdf; Supplier: LCSC; Convert to PCB: yes; Comment_1: CJ78L05